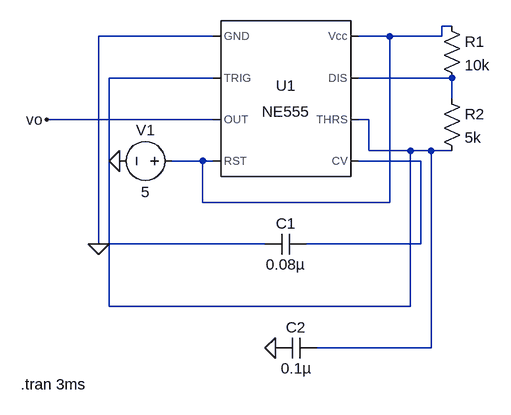
[diagram p0: schematic astable multivirator.asc]
astable multivirator.asc, the LTspice schematic file:
Version 4.1
SHEET 1 880 680
WIRE 416 48 400 48
WIRE 48 64 -128 64
WIRE 320 64 272 64
WIRE 400 64 400 48
WIRE 400 64 320 64
WIRE 48 128 -112 128
WIRE 416 128 272 128
WIRE 416 160 416 128
WIRE 48 192 -208 192
WIRE 288 192 272 192
WIRE 288 240 288 192
WIRE 352 240 288 240
WIRE 384 240 352 240
WIRE 416 240 384 240
WIRE 32 256 -16 256
WIRE 48 256 32 256
WIRE 368 256 272 256
WIRE 32 320 32 256
WIRE 320 320 320 64
WIRE 320 320 32 320
WIRE -128 384 -128 64
WIRE 128 384 -128 384
WIRE 368 384 368 256
WIRE 368 384 192 384
WIRE -112 480 -112 128
WIRE 352 480 352 240
WIRE 352 480 -112 480
WIRE 384 544 384 240
WIRE 384 544 208 544
FLAG -96 256 0
FLAG -128 384 0
FLAG -208 192 vo
FLAG 144 544 0
SYMBOL Misc\\NE555 160 160 R0
SYMATTR InstName U1
SYMBOL res 400 32 R0
SYMATTR InstName R1
SYMATTR Value 10k
SYMBOL res 400 144 R0
SYMATTR InstName R2
SYMATTR Value 5k
SYMBOL cap 192 368 R90
WINDOW 0 0 32 VBottom 2
WINDOW 3 32 32 VTop 2
SYMATTR InstName C1
SYMATTR Value 0.08µ
SYMBOL cap 208 528 R90
WINDOW 0 0 32 VBottom 2
WINDOW 3 32 32 VTop 2
SYMATTR InstName C2
SYMATTR Value 0.1µ
SYMBOL voltage 0 256 R90
WINDOW 0 -32 56 VBottom 2
WINDOW 3 32 56 VTop 2
WINDOW 123 0 0 Left 0
WINDOW 39 0 0 Left 0
SYMATTR InstName V1
SYMATTR Value 5
TEXT -248 600 Left 2 !.tran 3ms

The netlist it stands for:
* astable multivirator.asc
X§U1 0 N002 vo N001 N004 N002 N003 N001 NE555  ; pins GND TRIG OUT RST CV THRS DIS Vcc
R1 N001 N003 10k
R2 N003 N002 5k
C1 N004 0 0.08µ
C2 N002 0 0.1µ
V1 N001 0 5
.tran 3ms
.lib NE555.sub
.backanno
.end